# Altium project Driver-Main-Board-v1.0.PrjPcb (part 2 of 5)

## Sheet Connector-Sheet.SchDoc
size 420 x 297 mm; SheetNumber: 7; SheetTotal: 7
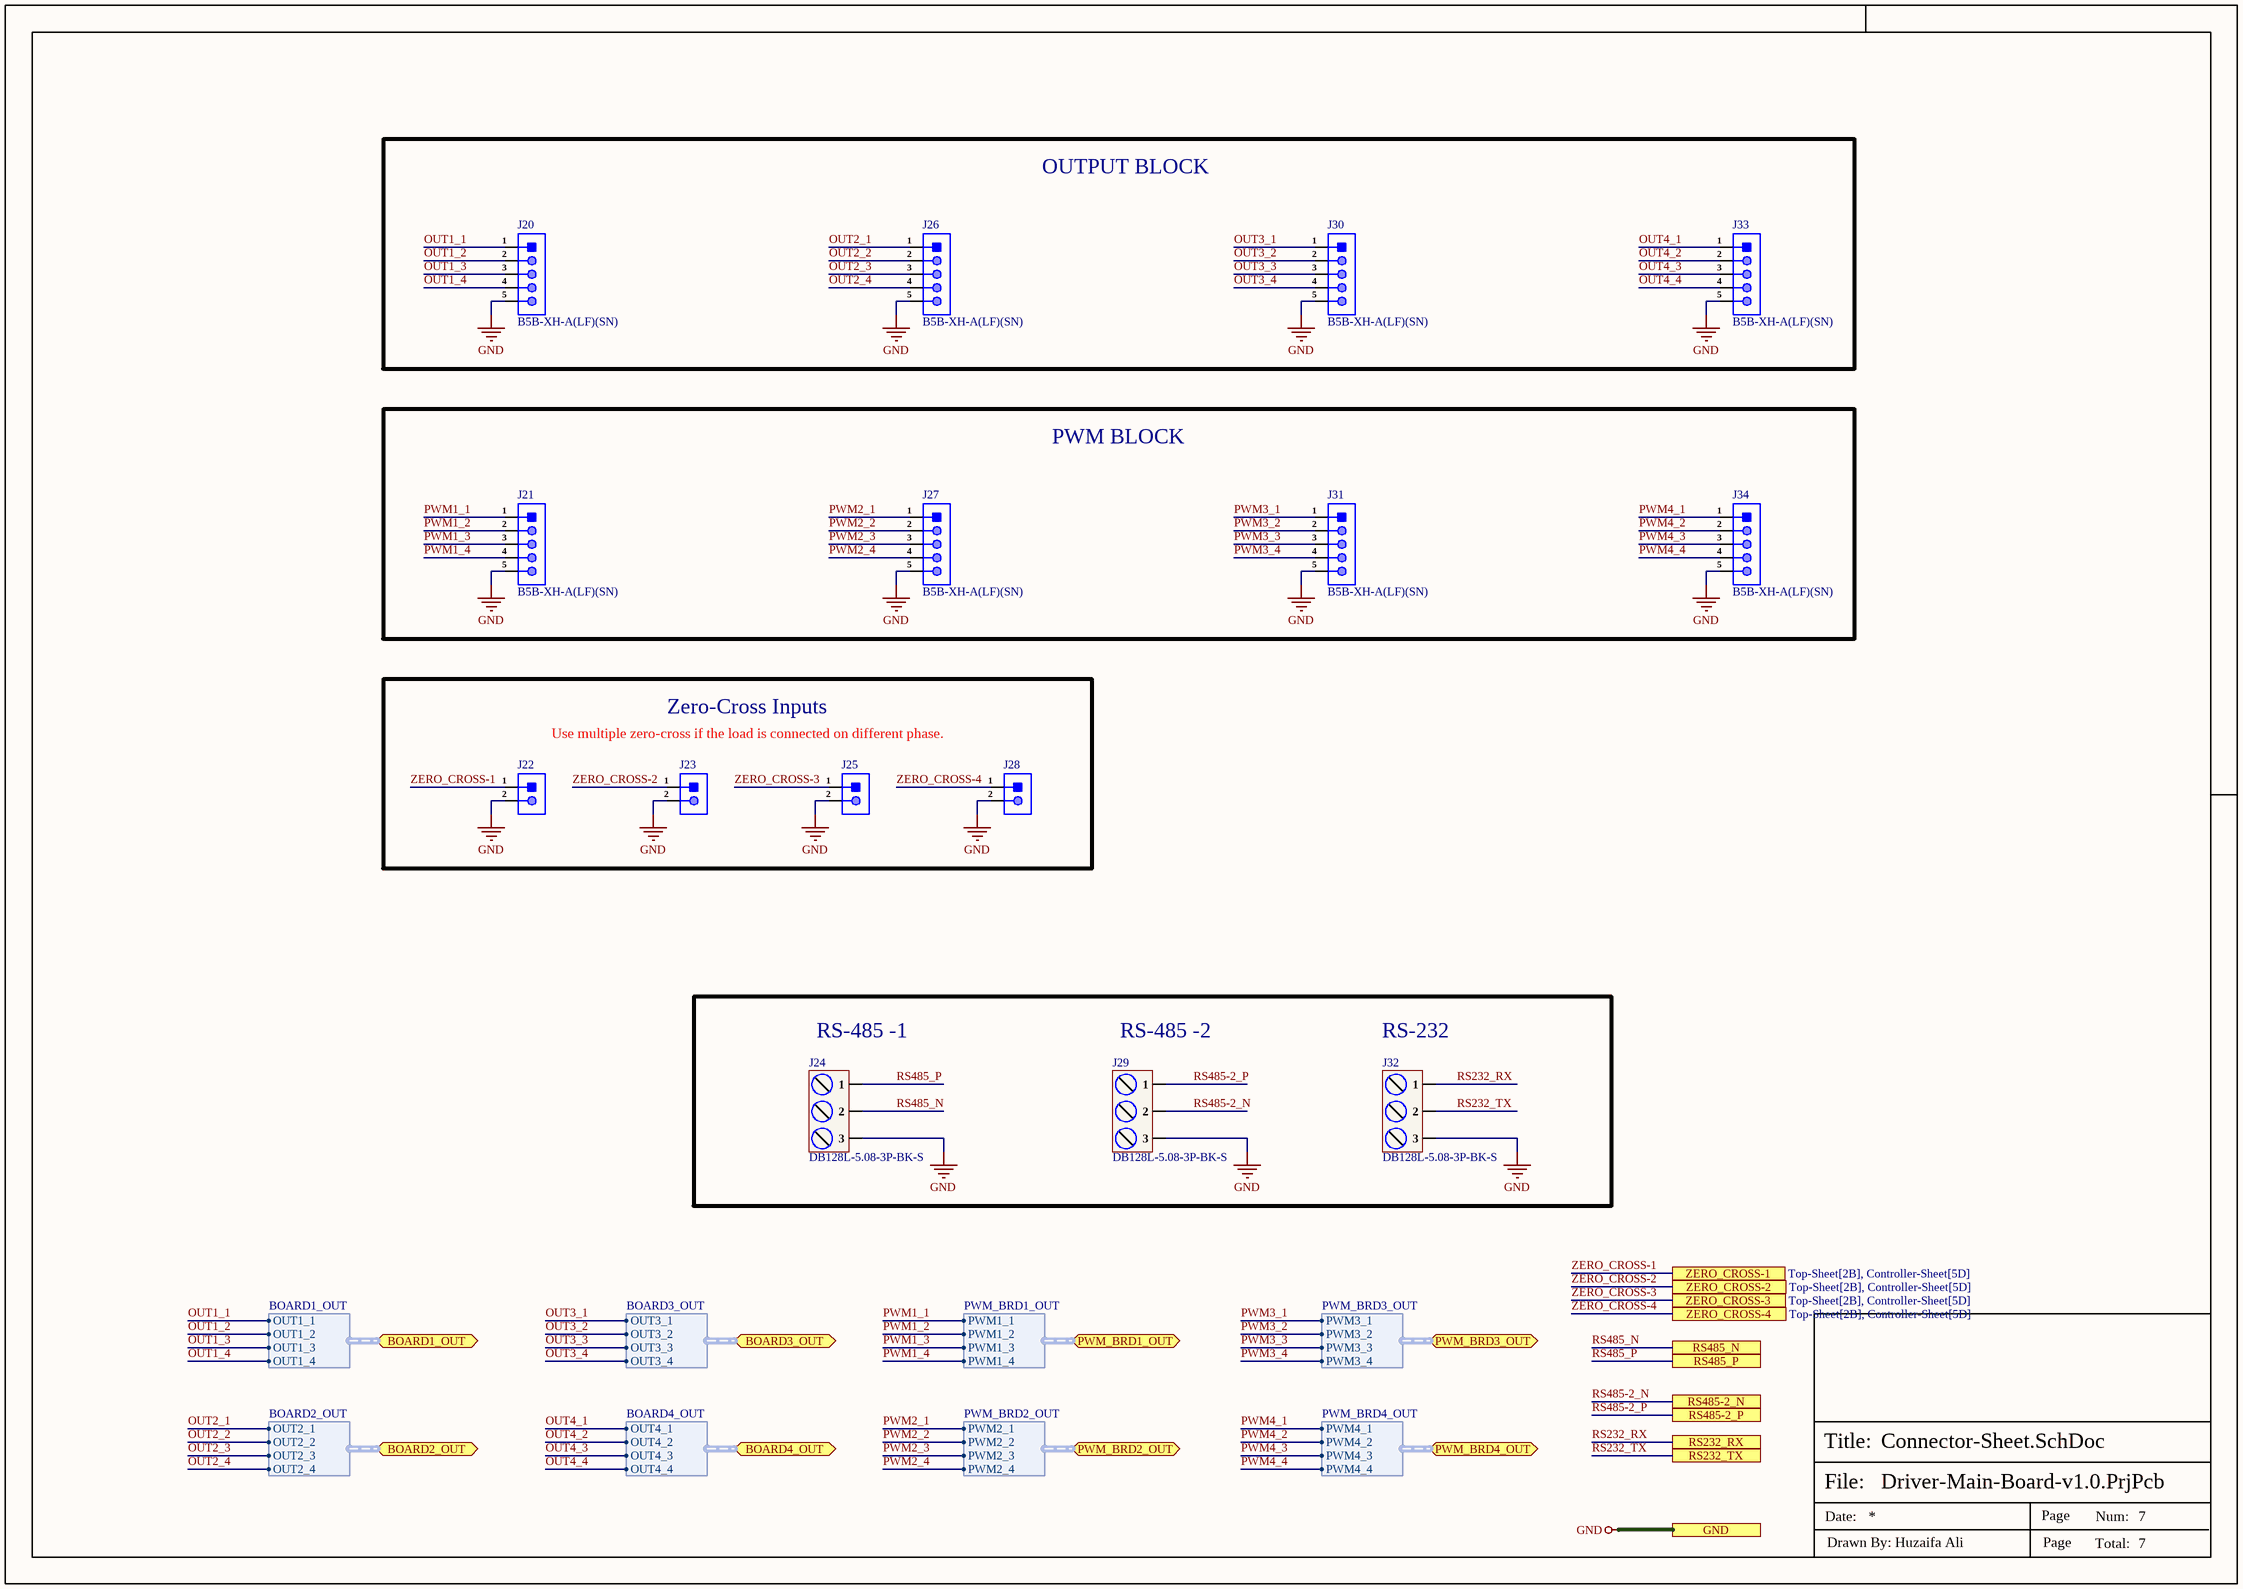
[diagram p3: Connector-Sheet.SchDoc]

### Parts
J20  B5B-XH-A(LF)(SN)  [B5B-XH-A(LF)(SN)_]
J21  B5B-XH-A(LF)(SN)  [B5B-XH-A(LF)(SN)_]
J22  B2B-XH-A(LF)(SN)  [B2B-XH-A(LF)(SN)_]  (value not drawn)
J23  B2B-XH-A(LF)(SN)  [B2B-XH-A(LF)(SN)_]  (value not drawn)
J24  DB128L-5.08-3P-BK-S  [DB128L-5.08-3P-BK-S]
J25  B2B-XH-A(LF)(SN)  [B2B-XH-A(LF)(SN)_]  (value not drawn)
J26  B5B-XH-A(LF)(SN)  [B5B-XH-A(LF)(SN)_]
J27  B5B-XH-A(LF)(SN)  [B5B-XH-A(LF)(SN)_]
J28  B2B-XH-A(LF)(SN)  [B2B-XH-A(LF)(SN)_]  (value not drawn)
J29  DB128L-5.08-3P-BK-S  [DB128L-5.08-3P-BK-S]
J30  B5B-XH-A(LF)(SN)  [B5B-XH-A(LF)(SN)_]
J31  B5B-XH-A(LF)(SN)  [B5B-XH-A(LF)(SN)_]
J32  DB128L-5.08-3P-BK-S  [DB128L-5.08-3P-BK-S]
J33  B5B-XH-A(LF)(SN)  [B5B-XH-A(LF)(SN)_]
J34  B5B-XH-A(LF)(SN)  [B5B-XH-A(LF)(SN)_]

### Blocks framed on the sheet
OUTPUT BLOCK: J20 J26 J30 J33
PWM BLOCK: J21 J27 J31 J34
Zero-Cross Inputs: J22 J23 J25 J28

### Ports
BOARD1_OUT (bidir, harness BOARD1_OUT, see Top-Sheet[2B], Controller-Sheet[1D]), BOARD2_OUT (bidir, harness BOARD2_OUT, see Top-Sheet[2B], Controller-Sheet[1D]), BOARD3_OUT (bidir, harness BOARD3_OUT, see Top-Sheet[2B], Controller-Sheet[2D]), BOARD4_OUT (bidir, harness BOARD4_OUT, see Top-Sheet[2B], Controller-Sheet[2D]), GND (see Top-Sheet[2B], CAN-Sheet[4D], Controller-Sheet[5D], EtherCAT-Sheet[5D], Power-Sheet[5D], RS485-RS232-Sheet[5D]), PWM_BRD1_OUT (bidir, harness PWM_BRD1_OUT, see Top-Sheet[2B], Controller-Sheet[1C]), PWM_BRD2_OUT (bidir, harness PWM_BRD2_OUT, see Top-Sheet[2B], Controller-Sheet[1D]), PWM_BRD3_OUT (bidir, harness PWM_BRD3_OUT, see Top-Sheet[2B], Controller-Sheet[2C]), PWM_BRD4_OUT (bidir, harness PWM_BRD4_OUT, see Top-Sheet[2B], Controller-Sheet[2D]), RS232_RX (see Top-Sheet[2B], RS485-RS232-Sheet[4D]), RS232_TX (see Top-Sheet[2B], RS485-RS232-Sheet[4D]), RS485-2_N (see Top-Sheet[2B], RS485-RS232-Sheet[4D]), RS485-2_P (see Top-Sheet[2B], RS485-RS232-Sheet[4D]), RS485_N (see Top-Sheet[2B], RS485-RS232-Sheet[4D]), RS485_P (see Top-Sheet[2B], RS485-RS232-Sheet[4D]), ZERO_CROSS-1 (see Top-Sheet[2B], Controller-Sheet[5D]), ZERO_CROSS-2 (see Top-Sheet[2B], Controller-Sheet[5D]), ZERO_CROSS-3 (see Top-Sheet[2B], Controller-Sheet[5D]), ZERO_CROSS-4 (see Top-Sheet[2B], Controller-Sheet[5D])

### Harnesses
BOARD1_OUT: OUT1_1, OUT1_2, OUT1_3, OUT1_4
BOARD2_OUT: OUT2_1, OUT2_2, OUT2_3, OUT2_4
BOARD3_OUT: OUT3_1, OUT3_2, OUT3_3, OUT3_4
BOARD4_OUT: OUT4_1, OUT4_2, OUT4_3, OUT4_4
PWM_BRD1_OUT: PWM1_1, PWM1_2, PWM1_3, PWM1_4
PWM_BRD2_OUT: PWM2_1, PWM2_2, PWM2_3, PWM2_4
PWM_BRD3_OUT: PWM3_1, PWM3_2, PWM3_3, PWM3_4
PWM_BRD4_OUT: PWM4_1, PWM4_2, PWM4_3, PWM4_4

### Nets
GND: J20.5 J21.5 J22.2 J23.2 J24.3 J25.2 J26.5 J27.5 J28.2 J29.3 J30.5 J31.5 J32.3 J33.5 J34.5 ; port GND
OUT1_1: J20.1 ; port BOARD1_OUT.OUT1_1
OUT1_2: J20.2 ; port BOARD1_OUT.OUT1_2
OUT1_3: J20.3 ; port BOARD1_OUT.OUT1_3
OUT1_4: J20.4 ; port BOARD1_OUT.OUT1_4
OUT2_1: J26.1 ; port BOARD2_OUT.OUT2_1
OUT2_2: J26.2 ; port BOARD2_OUT.OUT2_2
OUT2_3: J26.3 ; port BOARD2_OUT.OUT2_3
OUT2_4: J26.4 ; port BOARD2_OUT.OUT2_4
OUT3_1: J30.1 ; port BOARD3_OUT.OUT3_1
OUT3_2: J30.2 ; port BOARD3_OUT.OUT3_2
OUT3_3: J30.3 ; port BOARD3_OUT.OUT3_3
OUT3_4: J30.4 ; port BOARD3_OUT.OUT3_4
OUT4_1: J33.1 ; port BOARD4_OUT.OUT4_1
OUT4_2: J33.2 ; port BOARD4_OUT.OUT4_2
OUT4_3: J33.3 ; port BOARD4_OUT.OUT4_3
OUT4_4: J33.4 ; port BOARD4_OUT.OUT4_4
PWM1_1: J21.1 ; port PWM_BRD1_OUT.PWM1_1
PWM1_2: J21.2 ; port PWM_BRD1_OUT.PWM1_2
PWM1_3: J21.3 ; port PWM_BRD1_OUT.PWM1_3
PWM1_4: J21.4 ; port PWM_BRD1_OUT.PWM1_4
PWM2_1: J27.1 ; port PWM_BRD2_OUT.PWM2_1
PWM2_2: J27.2 ; port PWM_BRD2_OUT.PWM2_2
PWM2_3: J27.3 ; port PWM_BRD2_OUT.PWM2_3
PWM2_4: J27.4 ; port PWM_BRD2_OUT.PWM2_4
PWM3_1: J31.1 ; port PWM_BRD3_OUT.PWM3_1
PWM3_2: J31.2 ; port PWM_BRD3_OUT.PWM3_2
PWM3_3: J31.3 ; port PWM_BRD3_OUT.PWM3_3
PWM3_4: J31.4 ; port PWM_BRD3_OUT.PWM3_4
PWM4_1: J34.1 ; port PWM_BRD4_OUT.PWM4_1
PWM4_2: J34.2 ; port PWM_BRD4_OUT.PWM4_2
PWM4_3: J34.3 ; port PWM_BRD4_OUT.PWM4_3
PWM4_4: J34.4 ; port PWM_BRD4_OUT.PWM4_4
RS232_RX: J32.1 ; port RS232_RX
RS232_TX: J32.2 ; port RS232_TX
RS485-2_N: J29.2 ; port RS485-2_N
RS485-2_P: J29.1 ; port RS485-2_P
RS485_N: J24.2 ; port RS485_N
RS485_P: J24.1 ; port RS485_P
ZERO_CROSS-1: J22.1 ; port ZERO_CROSS-1
ZERO_CROSS-2: J23.1 ; port ZERO_CROSS-2
ZERO_CROSS-3: J25.1 ; port ZERO_CROSS-3
ZERO_CROSS-4: J28.1 ; port ZERO_CROSS-4

### Notes on the sheet
- Use multiple zero-cross if the load is connected on different phase.
- (near J24) RS-485 -1
- (near J29) RS-485 -2
- (near J32) RS-232
- File:
- Title:
- Date:
- Page
- Num:
- Total:
- Drawn By: Huzaifa Ali

### Library data of the parts
J20 J21 J26 J27 J30 J31 J33 J34 = B5B-XH-A(LF)(SN): Conn Shrouded Header HDR 5 POS 2.5mm Solder ST Thru-Hole Box; Manufacturer: JST; Current Rating: 3A; Contact Resistance: 20mR; Voltage Rating (AC): 250V; Number of Positions: 5; Insulation Resistance: 1GR; Gender: Male; Wire/Cable Gauge: 22AWG; Contact Post Length: 0.134inch; Mated Stacking Heights: 9.8mm; Item Type: JST Connector; Supplier 1: Digi-Key; Manufacturer Part Number: B5B-XH-A(LF)(SN); RoHS: Yes; Category: Headers and Wire Housings; Stock 1: 1949; Pricing 1: 1=0.25000, 10=0.23700, 100=0.16440, 500=0.13914, 1000=0.11383, 5000=0.10119, 10000=0.09170 (USD); Mount: Through Hole; Contact Material: Brass; Color: Natural; Contact Plating: Tin,Lead,Copper; Housing Color: White; Housing Material: Polyamide; Contact Shape: Square; Contact Finish - Mating: TIN; Insulation Material: Nylon; Insulation Color: Natural; Min Operating Temperature: -25°C; Max Operating Temperature: 85°C; Number of Rows: 1; Packaging: Bulk; Voltage Rating: 250V; Max Current Rating: 3A; Termination: Press-Fit; Fastening Type: Detent; Number of Contacts: 5; Max Voltage Rating (AC): 250V; Orientation: Straight; Connector Type: Header; Series: XH; Contact Type: Male Pin; Length: 14.9mm; Pitch: 2.5mm; Lead Pitch: 2.5mm; Depth: 5.75mm; Insulation Height: 0.276inch; REACH SVHC: No SVHC; Lead Free: Lead Free; Flammability Rating: UL94 V-0; ComponentLink1URL: https://datasheet.ciiva.com/26894/getdatasheetpartid-455618-26894798.pdf?src-supplier=Verical; ComponentLink1Description: https://datasheet.ciiva.com/26894/getdatasheetpartid-455618-26894798.pdf?src-supplier=Verical; ComponentLink2URL: https://datasheet.ciiva.com/11746/0900766b8082f55f-11746654.pdf?src-supplier=RSComponents; ComponentLink2Description: https://datasheet.ciiva.com/11746/0900766b8082f55f-11746654.pdf?src-supplier=RSComponents; ComponentLink3URL: https://datasheet.ciiva.com/26894/getdatasheetpartid-640991-26894479.pdf?src-supplier=Verical; ComponentLink3Description: https://datasheet.ciiva.com/26894/getdatasheetpartid-640991-26894479.pdf?src-supplier=Verical; ComponentLink4URL: https://datasheet.ciiva.com/8052/1684882-8052063.pdf?src-supplier=Element14; ComponentLink4Description: https://datasheet.ciiva.com/8052/1684882-8052063.pdf?src-supplier=Element14; ComponentLink5URL: https://datasheet.ciiva.com/20207/523653-20207174.pdf?src-supplier=Rapid+Electronics; ComponentLink5Description: https://datasheet.ciiva.com/20207/523653-20207174.pdf?src-supplier=Rapid+Electronics; ComponentLink6URL: https://datasheet.ciiva.com/724/exh-724390.pdf?src-supplier=Digi-Key; ComponentLink6Description: https://datasheet.ciiva.com/724/exh-724390.pdf?src-supplier=Digi-Key; Supplier Part Number 1: 455-2270-ND; LCSC Part Number: C157991
J22 J23 J25 J28 = B2B-XH-A(LF)(SN): Conn Shrouded Header (4 Sides) HDR 2 POS 2.5mm Solder ST Thru-Hole Box; Manufacturer: JST; Number of Positions: 2; Connector Type: Male Pin; Current Rating: 3A; Contact Resistance: 20mR; Voltage Rating: 250V; Insulation Resistance: 1GR; Wire/Cable Gauge: 22AWG; Item Type: JST Connector; Supplier 1: Farnell; Manufacturer Part Number: B2B-XH-A(LF)(SN); RoHS: Yes; Category: FFC / FPC; Stock 1: 219240; Pricing 1: 100=0.06860, 1000=0.04800, 2500=0.04520, 5000=0.04230, 10000=0.03950, 20000=0.03660 (GBP); Mount: Through Hole; Contact Plating: Tin,Copper,Lead; Color: Natural; Contact Material: Brass; Housing Color: White; Housing Material: Polyamide; Min Operating Temperature: -25°C; Max Operating Temperature: 85°C; Number of Rows: 1; Packaging: Bulk; Termination: Solder; Fastening Type: Detent; Max Current Rating: 3A; Voltage Rating (AC): 250V; Max Voltage Rating (AC): 250V; Number of Contacts: 2; Max Voltage Rating (DC): 250V; Orientation: Straight; Length: 7.4mm; Pitch: 2.5mm; Lead Pitch: 2.5mm; Depth: 5.75mm; REACH SVHC: No SVHC; Lead Free: Lead Free; ComponentLink1URL: https://datasheet.ciiva.com/26894/getdatasheetpartid-640357-26894434.pdf?src-supplier=Verical; ComponentLink1Description: https://datasheet.ciiva.com/26894/getdatasheetpartid-640357-26894434.pdf?src-supplier=Verical; ComponentLink2URL: https://datasheet.ciiva.com/11746/0900766b8082653e-11746979.pdf?src-supplier=RSComponents; ComponentLink2Description: https://datasheet.ciiva.com/11746/0900766b8082653e-11746979.pdf?src-supplier=RSComponents; ComponentLink3URL: https://datasheet.ciiva.com/26894/getdatasheetpartid-385291-26894760.pdf?src-supplier=Verical; ComponentLink3Description: https://datasheet.ciiva.com/26894/getdatasheetpartid-385291-26894760.pdf?src-supplier=Verical; ComponentLink4URL: https://datasheet.ciiva.com/8052/5448-8052024.pdf?src-supplier=Element14; ComponentLink4Description: https://datasheet.ciiva.com/8052/5448-8052024.pdf?src-supplier=Element14; ComponentLink5URL: https://datasheet.ciiva.com/20207/523653-20207167.pdf?src-supplier=Rapid+Electronics; ComponentLink5Description: https://datasheet.ciiva.com/20207/523653-20207167.pdf?src-supplier=Rapid+Electronics; Supplier Part Number 1: 1516276; LCSC Part Number: C158012
J24 J29 J32 = DB128L-5.08-3P-BK-S: 1x3P 18A -40℃~+105℃ 250V Black 12~30 Straight pin 5.08mm 2.5 1 3 Plugin,P=5.08mm Screw terminal ROHS; Manufacturer: DIBO; Item Type: Terminal Block; Manufacturer Part Number: DB128L-5.08-3P-BK-S; Package: Plugin,P=5.08mm; LCSC Part Number: C430602; ComponentLink1Description: LCSC; ComponentLink1URL: https://www.lcsc.com/product-detail/Screw-terminal_DIBO-DB128L-5-08-3P-BK-S_C430602.html

## Sheet Controller-Sheet.SchDoc
size 420 x 297 mm; SheetNumber: 3; SheetTotal: 7
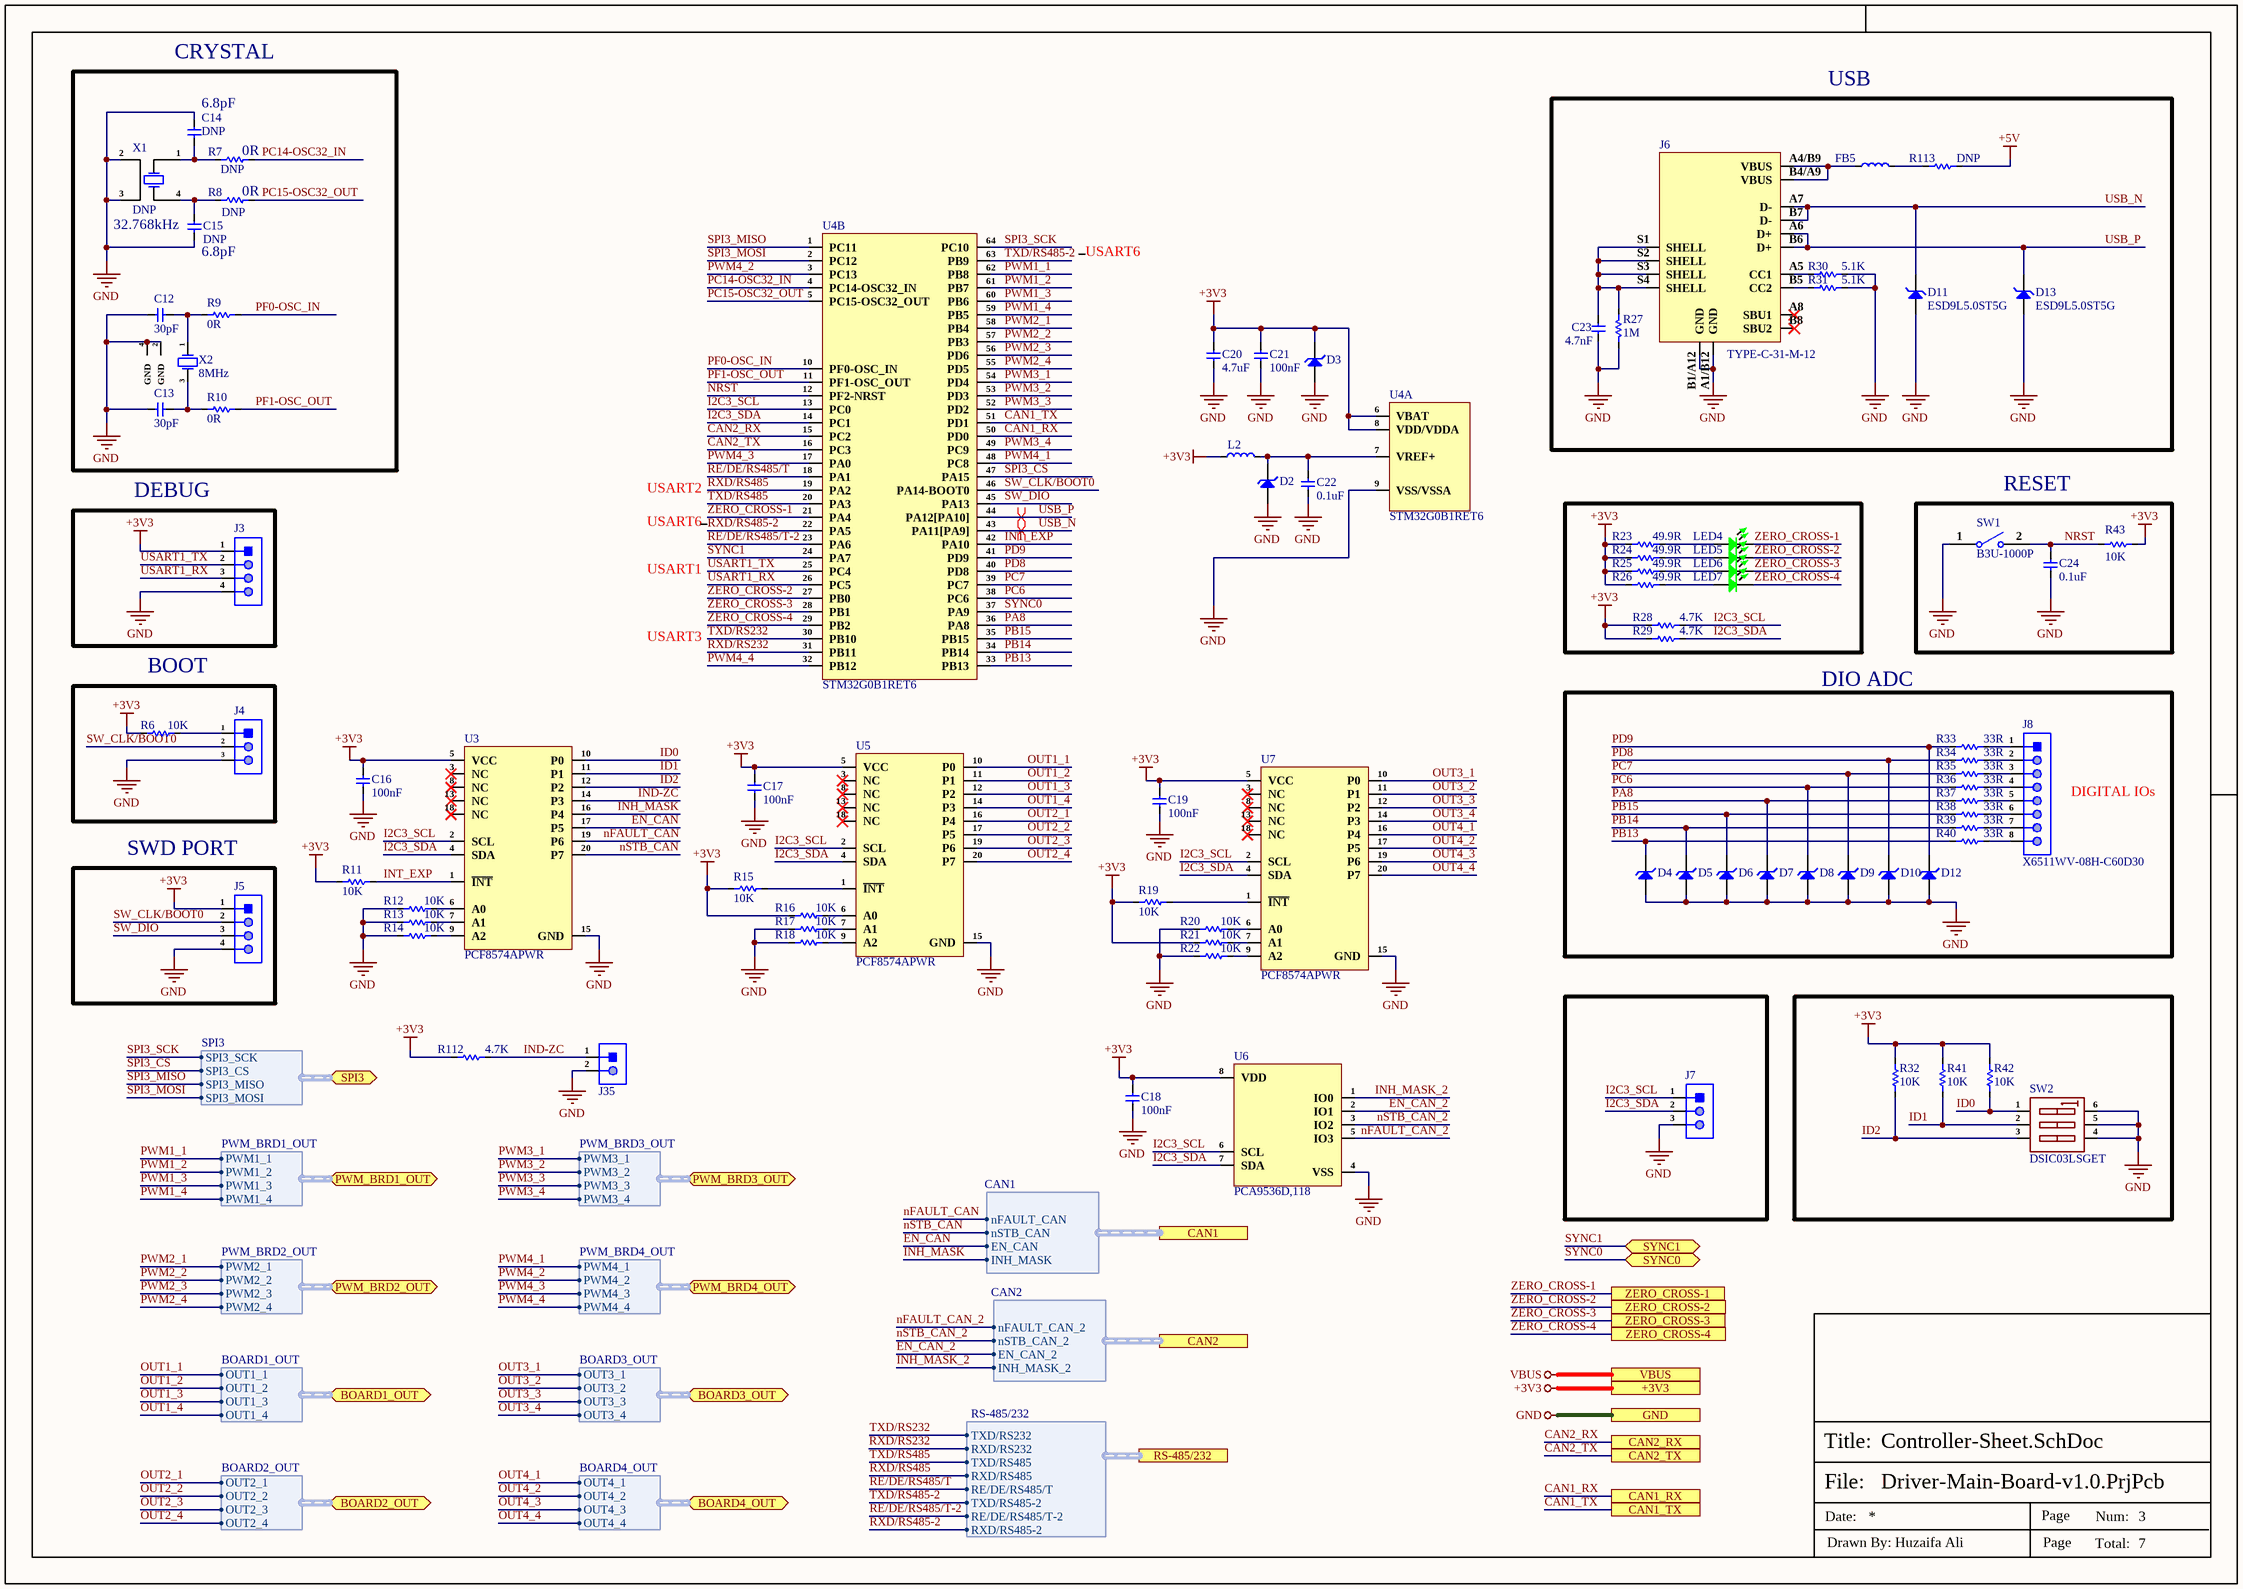
[diagram p4: Controller-Sheet.SchDoc]

### Parts
C12  30pF  [Cap-0402]
C13  30pF  [Cap-0402]
C14  DNP  [Cap-0402]
C15  DNP  [Cap-0402]
C16  100nF  [cap-0402]
C17  100nF  [cap-0402]
C18  100nF  [cap-0402]
C19  100nF  [cap-0402]
C20  4.7uF  [Cap-0402]
C21  100nF  [cap-0402]
C22  0.1uF  [Cap-0402]
C23  4.7nF  [Cap-0603]
C24  0.1uF  [Cap-0402]
D2  SD03  [SOD-323]  (value not drawn)
D3  SD03  [SOD-323]  (value not drawn)
D4  MM3Z3V3  [SOD-323]  (value not drawn)
D5  MM3Z3V3  [SOD-323]  (value not drawn)
D6  MM3Z3V3  [SOD-323]  (value not drawn)
D7  MM3Z3V3  [SOD-323]  (value not drawn)
D8  MM3Z3V3  [SOD-323]  (value not drawn)
D9  MM3Z3V3  [SOD-323]  (value not drawn)
D10  MM3Z3V3  [SOD-323]  (value not drawn)
D11  ESD9L5.0ST5G  [SOD-923.]
D12  MM3Z3V3  [SOD-323]  (value not drawn)
D13  ESD9L5.0ST5G  [SOD-923.]
FB5  BLM18PG221SN1D  [IND-0603 (1608 Metric)]  (value not drawn)
J3  X6511WV-04H-C60D30  [HDR1X4_]  (value not drawn)
J4  68000-103HLF  [HDR1X3_]  (value not drawn)
J5  X6511WV-04H-C60D30  [HDR1X4_]  (value not drawn)
J6  TYPE-C-31-M-12  [TYPE-C-31-M-12_]
J7  B3B-XH-A(LF)(SN)  [B3B-XH-A(LF)(SN)_]  (value not drawn)
J8  X6511WV-08H-C60D30  [HDR 1x8 TH male]
J35  X6511WV-02H-C60D30  [HDR1X2_]  (value not drawn)
L2  BLM15AG601SN1D  [IND-0402]  (value not drawn)
LED4  Emerald  [LED-0603]  (value not drawn)
LED5  Emerald  [LED-0603]  (value not drawn)
LED6  Emerald  [LED-0603]  (value not drawn)
LED7  Emerald  [LED-0603]  (value not drawn)
R6  10K  [Res-0402]
R7  DNP  [Res-0603]
R8  DNP  [Res-0603]
R9  0R  [Res-0603]
R10  0R  [Res-0603]
R11  10K  [Res-0402]
R12  10K  [Res-0402]
R13  10K  [Res-0402]
R14  10K  [Res-0402]
R15  10K  [Res-0402]
R16  10K  [Res-0402]
R17  10K  [Res-0402]
R18  10K  [Res-0402]
R19  10K  [Res-0402]
R20  10K  [Res-0402]
R21  10K  [Res-0402]
R22  10K  [Res-0402]
R23  49.9R  [Res-0603]
R24  49.9R  [Res-0603]
R25  49.9R  [Res-0603]
R26  49.9R  [Res-0603]
R27  1M  [Res-0402]
R28  4.7K  [Res-0402]
R29  4.7K  [Res-0402]
R30  5.1K  [Res-0402]
R31  5.1K  [Res-0402]
R32  10K  [Res-0402]
R33  33R  [Res-0402]
R34  33R  [Res-0402]
R35  33R  [Res-0402]
R36  33R  [Res-0402]
R37  33R  [Res-0402]
R38  33R  [Res-0402]
R39  33R  [Res-0402]
R40  33R  [Res-0402]
R41  10K  [Res-0402]
R42  10K  [Res-0402]
R43  10K  [Res-0402]
R112  4.7K  [Res-0402]
R113  DNP  [Res-0402]
SW1  B3U-1000P  [B3U-1000P]
SW2  DSIC03LSGET  [DSIC03LSGET]
U3  PCF8574APWR  [TSSOP-20]
U4  STM32G0B1RET6  [LQFP-64(10x10)]  (parts A,B of 2)
U5  PCF8574APWR  [TSSOP-20]
U6  PCA9536D,118  [SOP-8]
U7  PCF8574APWR  [TSSOP-20]
X1  DNP  [MC-306]
X2  8MHz  [5TJ480000XYLBC_]

### Blocks framed on the sheet
CRYSTAL: C12-C15 R7-R10 X1 X2
USB: C23 D11 D13 FB5 J6 R27 R30 R31 R113
DEBUG: J3
RESET: C24 R43 SW1
BOOT: J4 R6
DIO ADC: D4-D10 D12 J8 R33-R40
SWD PORT: J5

### Ports
+3V3 (see Top-Sheet[3A], CAN-Sheet[4D], EtherCAT-Sheet[5D], Power-Sheet[5D], RS485-RS232-Sheet[5D]), BOARD1_OUT (bidir, harness BOARD1_OUT, see Top-Sheet[3B], Connector-Sheet[1D]), BOARD2_OUT (bidir, harness BOARD2_OUT, see Top-Sheet[3B], Connector-Sheet[1D]), BOARD3_OUT (bidir, harness BOARD3_OUT, see Top-Sheet[3B], Connector-Sheet[2D]), BOARD4_OUT (bidir, harness BOARD4_OUT, see Top-Sheet[3B], Connector-Sheet[2D]), CAN1 (harness CAN1, see Top-Sheet[4B], CAN-Sheet[3D]), CAN1_RX (see Top-Sheet[4B], CAN-Sheet[2D]), CAN1_TX (see Top-Sheet[4B], CAN-Sheet[2D]), CAN2 (harness CAN2, see Top-Sheet[4B], CAN-Sheet[3D]), CAN2_RX (see Top-Sheet[4B], CAN-Sheet[2D]), CAN2_TX (see Top-Sheet[4B], CAN-Sheet[2D]), GND (see Top-Sheet[3A], CAN-Sheet[4D], Connector-Sheet[5D], EtherCAT-Sheet[5D], Power-Sheet[5D], RS485-RS232-Sheet[5D]), PWM_BRD1_OUT (bidir, harness PWM_BRD1_OUT, see Top-Sheet[3B], Connector-Sheet[3D]), PWM_BRD2_OUT (bidir, harness PWM_BRD2_OUT, see Top-Sheet[3B], Connector-Sheet[3D]), PWM_BRD3_OUT (bidir, harness PWM_BRD3_OUT, see Top-Sheet[3B], Connector-Sheet[4D]), PWM_BRD4_OUT (bidir, harness PWM_BRD4_OUT, see Top-Sheet[3B], Connector-Sheet[4D]), RS-485/232 (harness RS-485/232, see Top-Sheet[3B], RS485-RS232-Sheet[2D]), SPI3 (bidir, harness SPI3, see Top-Sheet[4B], EtherCAT-Sheet[1D]), SYNC0 (bidir, see Top-Sheet[4B], EtherCAT-Sheet[5D]), SYNC1 (bidir, see Top-Sheet[4B], EtherCAT-Sheet[5D]), VBUS (see Top-Sheet[3A]), ZERO_CROSS-1 (see Top-Sheet[3B], Connector-Sheet[5D]), ZERO_CROSS-2 (see Top-Sheet[3B], Connector-Sheet[5D]), ZERO_CROSS-3 (see Top-Sheet[3B], Connector-Sheet[5D]), ZERO_CROSS-4 (see Top-Sheet[3B], Connector-Sheet[5D])

### Harnesses
CAN1: nFAULT_CAN, nSTB_CAN, EN_CAN, INH_MASK
CAN2: nFAULT_CAN_2, nSTB_CAN_2, EN_CAN_2, INH_MASK_2
SPI3: SPI3_SCK, SPI3_CS, SPI3_MISO, SPI3_MOSI
RS-485/232: TXD/RS232, RXD/RS232, TXD/RS485, RXD/RS485, RE/DE/RS485/T, TXD/RS485-2, RE/DE/RS485/T-2, RXD/RS485-2
BOARD1_OUT: OUT1_1, OUT1_2, OUT1_3, OUT1_4
BOARD2_OUT: OUT2_1, OUT2_2, OUT2_3, OUT2_4
BOARD3_OUT: OUT3_1, OUT3_2, OUT3_3, OUT3_4
BOARD4_OUT: OUT4_1, OUT4_2, OUT4_3, OUT4_4
PWM_BRD1_OUT: PWM1_1, PWM1_2, PWM1_3, PWM1_4
PWM_BRD2_OUT: PWM2_1, PWM2_2, PWM2_3, PWM2_4
PWM_BRD3_OUT: PWM3_1, PWM3_2, PWM3_3, PWM3_4
PWM_BRD4_OUT: PWM4_1, PWM4_2, PWM4_3, PWM4_4

### Nets
+3V3: C16.2 C17.2 C18.2 C19.2 C20.2 C21.2 D3.1(K) J3.1 J5.1 L2.1 R6.2 R11.2 R15.2 R16.2 R19.2 R21.2 R23.1 R24.1 R25.1 R26.1 R28.2 R29.2 R32.2 R41.2 R42.2 R43.2 R112.2 U3.5(VCC) U4.6(VBAT) U4.8(VDD/VDDA) U5.5(VCC) U6.8(VDD) U7.5(VCC) ; port +3V3
+5V: R113.2
GND: C12.1 C13.1 C14.1 C15.2 C16.1 C17.1 C18.1 C19.1 C20.1 C21.1 C22.1 C23.1 C24.1 D2.2(A) D3.2(A) D4.2(A) D5.2(A) D6.2(A) D7.2(A) D8.2(A) D9.2(A) D10.2(A) D11.2(A) D12.2(A) D13.2(A) J3.4 J4.3 J5.4 J6.A1/B12(GND) J6.B1/A12(GND) J7.3 J35.2 R12.2 R13.2 R14.2 R17.2 R18.2 R20.2 R22.2 R27.2 R30.2 R31.2 SW1.1 SW2.4(B3) SW2.5(B2) SW2.6(B1) U3.15(GND) U4.9(VSS/VSSA) U5.15(GND) U6.4(VSS) U7.15(GND) X1.2 X1.3 X2.2(GND) X2.4(GND) ; port GND
VBUS: port VBUS
CAN1_RX: U4.50(PD0) ; port CAN1_RX
CAN1_TX: U4.51(PD1) ; port CAN1_TX
CAN2_RX: U4.15(PC2) ; port CAN2_RX
CAN2_TX: U4.16(PC3) ; port CAN2_TX
EN_CAN: U3.17(P5) ; port CAN1.EN_CAN
EN_CAN_2: U6.2(IO1) ; port CAN2.EN_CAN_2
I2C3_SCL: J7.1 R28.1 U3.2(SCL) U4.13(PC0) U5.2(SCL) U6.6(SCL) U7.2(SCL)
I2C3_SDA: J7.2 R29.1 U3.4(SDA) U4.14(PC1) U5.4(SDA) U6.7(SDA) U7.4(SDA)
ID0: R42.1 SW2.1(A1) U3.10(P0)
ID1: R41.1 SW2.2(A2) U3.11(P1)
ID2: R32.1 SW2.3(A3) U3.12(P2)
IND-ZC: J35.1 R112.1 U3.14(P3)
INH_MASK: U3.16(P4) ; port CAN1.INH_MASK
INH_MASK_2: U6.1(IO0) ; port CAN2.INH_MASK_2
INT_EXP: R11.1 U3.1(~{INT}) U4.42(PA10)
nFAULT_CAN: U3.19(P6) ; port CAN1.nFAULT_CAN
nFAULT_CAN_2: U6.5(IO3) ; port CAN2.nFAULT_CAN_2
NRST: C24.2 R43.1 SW1.2 U4.12(PF2-NRST)
nSTB_CAN: U3.20(P7) ; port CAN1.nSTB_CAN
nSTB_CAN_2: U6.3(IO2) ; port CAN2.nSTB_CAN_2
OUT1_1: U5.10(P0) ; port BOARD1_OUT.OUT1_1
OUT1_2: U5.11(P1) ; port BOARD1_OUT.OUT1_2
OUT1_3: U5.12(P2) ; port BOARD1_OUT.OUT1_3
OUT1_4: U5.14(P3) ; port BOARD1_OUT.OUT1_4
OUT2_1: U5.16(P4) ; port BOARD2_OUT.OUT2_1
OUT2_2: U5.17(P5) ; port BOARD2_OUT.OUT2_2
OUT2_3: U5.19(P6) ; port BOARD2_OUT.OUT2_3
OUT2_4: U5.20(P7) ; port BOARD2_OUT.OUT2_4
OUT3_1: U7.10(P0) ; port BOARD3_OUT.OUT3_1
OUT3_2: U7.11(P1) ; port BOARD3_OUT.OUT3_2
OUT3_3: U7.12(P2) ; port BOARD3_OUT.OUT3_3
OUT3_4: U7.14(P3) ; port BOARD3_OUT.OUT3_4
OUT4_1: U7.16(P4) ; port BOARD4_OUT.OUT4_1
OUT4_2: U7.17(P5) ; port BOARD4_OUT.OUT4_2
OUT4_3: U7.19(P6) ; port BOARD4_OUT.OUT4_3
OUT4_4: U7.20(P7) ; port BOARD4_OUT.OUT4_4
PA8: D7.1(K) R37.1 U4.36(PA8)
PB13: D4.1(K) R40.1 U4.33(PB13)
PB14: D5.1(K) R39.1 U4.34(PB14)
PB15: D6.1(K) R38.1 U4.35(PB15)
PC6: D8.1(K) R36.1 U4.38(PC6)
PC7: D9.1(K) R35.1 U4.39(PC7)
PC14-OSC32_IN: R7.2 U4.4(PC14-OSC32_IN)
PC15-OSC32_OUT: R8.2 U4.5(PC15-OSC32_OUT)
PD8: D10.1(K) R34.1 U4.40(PD8)
PD9: D12.1(K) R33.1 U4.41(PD9)
PF0-OSC_IN: R9.2 U4.10(PF0-OSC_IN)
PF1-OSC_OUT: R10.2 U4.11(PF1-OSC_OUT)
PWM1_1: U4.62(PB8) ; port PWM_BRD1_OUT.PWM1_1
PWM1_2: U4.61(PB7) ; port PWM_BRD1_OUT.PWM1_2
PWM1_3: U4.60(PB6) ; port PWM_BRD1_OUT.PWM1_3
PWM1_4: U4.59(PB5) ; port PWM_BRD1_OUT.PWM1_4
PWM2_1: U4.58(PB4) ; port PWM_BRD2_OUT.PWM2_1
PWM2_2: U4.57(PB3) ; port PWM_BRD2_OUT.PWM2_2
PWM2_3: U4.56(PD6) ; port PWM_BRD2_OUT.PWM2_3
PWM2_4: U4.55(PD5) ; port PWM_BRD2_OUT.PWM2_4
PWM3_1: U4.54(PD4) ; port PWM_BRD3_OUT.PWM3_1
PWM3_2: U4.53(PD3) ; port PWM_BRD3_OUT.PWM3_2
PWM3_3: U4.52(PD2) ; port PWM_BRD3_OUT.PWM3_3
PWM3_4: U4.49(PC9) ; port PWM_BRD3_OUT.PWM3_4
PWM4_1: U4.48(PC8) ; port PWM_BRD4_OUT.PWM4_1
PWM4_2: U4.3(PC13) ; port PWM_BRD4_OUT.PWM4_2
PWM4_3: U4.17(PA0) ; port PWM_BRD4_OUT.PWM4_3
PWM4_4: U4.32(PB12) ; port PWM_BRD4_OUT.PWM4_4
RE/DE/RS485/T: U4.18(PA1) ; port RS-485/232.RE/DE/RS485/T
RE/DE/RS485/T-2: U4.23(PA6) ; port RS-485/232.RE/DE/RS485/T-2
RXD/RS232: U4.31(PB11) ; port RS-485/232.RXD/RS232
RXD/RS485: U4.19(PA2) ; port RS-485/232.RXD/RS485
RXD/RS485-2: U4.22(PA5) ; port RS-485/232.RXD/RS485-2
SPI3_CS: U4.47(PA15) ; port SPI3.SPI3_CS
SPI3_MISO: U4.1(PC11) ; port SPI3.SPI3_MISO
SPI3_MOSI: U4.2(PC12) ; port SPI3.SPI3_MOSI
SPI3_SCK: U4.64(PC10) ; port SPI3.SPI3_SCK
SW_CLK/BOOT0: J4.2 J5.2 U4.46(PA14-BOOT0)
SW_DIO: J5.3 U4.45(PA13)
SYNC0: U4.37(PA9) ; port SYNC0
SYNC1: U4.24(PA7) ; port SYNC1
TXD/RS232: U4.30(PB10) ; port RS-485/232.TXD/RS232
TXD/RS485: U4.20(PA3) ; port RS-485/232.TXD/RS485
TXD/RS485-2: U4.63(PB9) ; port RS-485/232.TXD/RS485-2
USART1_RX: J3.3 U4.26(PC5)
USART1_TX: J3.2 U4.25(PC4)
USB_N: D11.1(K) J6.A7(D-) J6.B7(D-) U4.43(PA11[PA9])
USB_P: D13.1(K) J6.A6(D+) J6.B6(D+) U4.44(PA12[PA10])
ZERO_CROSS-1: LED4.2 U4.21(PA4) ; port ZERO_CROSS-1
ZERO_CROSS-2: LED5.2 U4.27(PB0) ; port ZERO_CROSS-2
ZERO_CROSS-3: LED6.2 U4.28(PB1) ; port ZERO_CROSS-3
ZERO_CROSS-4: LED7.2 U4.29(PB2) ; port ZERO_CROSS-4
NetC12_2: C12.2 R9.1 X2.1(OSC1)
NetC13_2: C13.2 R10.1 X2.3(OSC2)
NetC14_2: C14.2 R7.1 X1.1(OSC1)
NetC15_1: C15.1 R8.1 X1.4(OSC2)
NetC22_2: C22.2 D2.1(K) L2.2 U4.7(VREF+)
NetC23_2: C23.2 J6.S1(SHELL) J6.S2(SHELL) J6.S3(SHELL) J6.S4(SHELL) R27.1
NetFB5_1: FB5.1 J6.A4/B9(VBUS) J6.B4/A9(VBUS)
NetFB5_2: FB5.2 R113.1
NetJ4_1: J4.1 R6.1
NetJ6_A5: J6.A5(CC1) R30.1
NetJ6_B5: J6.B5(CC2) R31.1
NetJ8_1: J8.1 R33.2
NetJ8_2: J8.2 R34.2
NetJ8_3: J8.3 R35.2
NetJ8_4: J8.4 R36.2
NetJ8_5: J8.5 R37.2
NetJ8_6: J8.6 R38.2
NetJ8_7: J8.7 R39.2
NetJ8_8: J8.8 R40.2
NetLED4_1: LED4.1 R23.2
NetLED5_1: LED5.1 R24.2
NetLED6_1: LED6.1 R25.2
NetLED7_1: LED7.1 R26.2
NetR12_1: R12.1 U3.6(A0)
NetR13_1: R13.1 U3.7(A1)
NetR14_1: R14.1 U3.9(A2)
NetR15_1: R15.1 U5.1(~{INT})
NetR16_1: R16.1 U5.6(A0)
NetR17_1: R17.1 U5.7(A1)
NetR18_1: R18.1 U5.9(A2)
NetR19_1: R19.1 U7.1(~{INT})
NetR20_1: R20.1 U7.6(A0)
NetR21_1: R21.1 U7.7(A1)
NetR22_1: R22.1 U7.9(A2)

Not connected (* = marked no-connect by the designer): J6 A8(SBU1)* B8(SBU2)*; U3 3(NC)* 8(NC)* 13(NC)* 18(NC)*; U5 3(NC)* 8(NC)* 13(NC)* 18(NC)*; U7 3(NC)* 8(NC)* 13(NC)* 18(NC)*

### Layout directives
differential pair; net class USB_PROGRAM; differential pair class USB_PROGRAM_LINES; rule Impedance Constraint [Min = 85.00    Max = 90.00    ]; rule Matched Net Lengths [Tolerance = 50mil]: USB_N, USB_P

### Notes on the sheet
- (near C14) 6.8pF
- (near R7) 0R
- 32.768kHz
- (near C15) 6.8pF
- (near R8) 0R
- USART6
- USART2
- USART1
- USART3
- (near J8) DIGITAL IOs
- DIGITAL IOs REQUESTED BY CLIENT
- File:
- Title:
- Date:
- Page
- Num:
- Total:
- Drawn By: Huzaifa Ali